# Altium schematic sheet Input.SchDoc
size A4; SheetNumber: 5; SheetTotal: 6
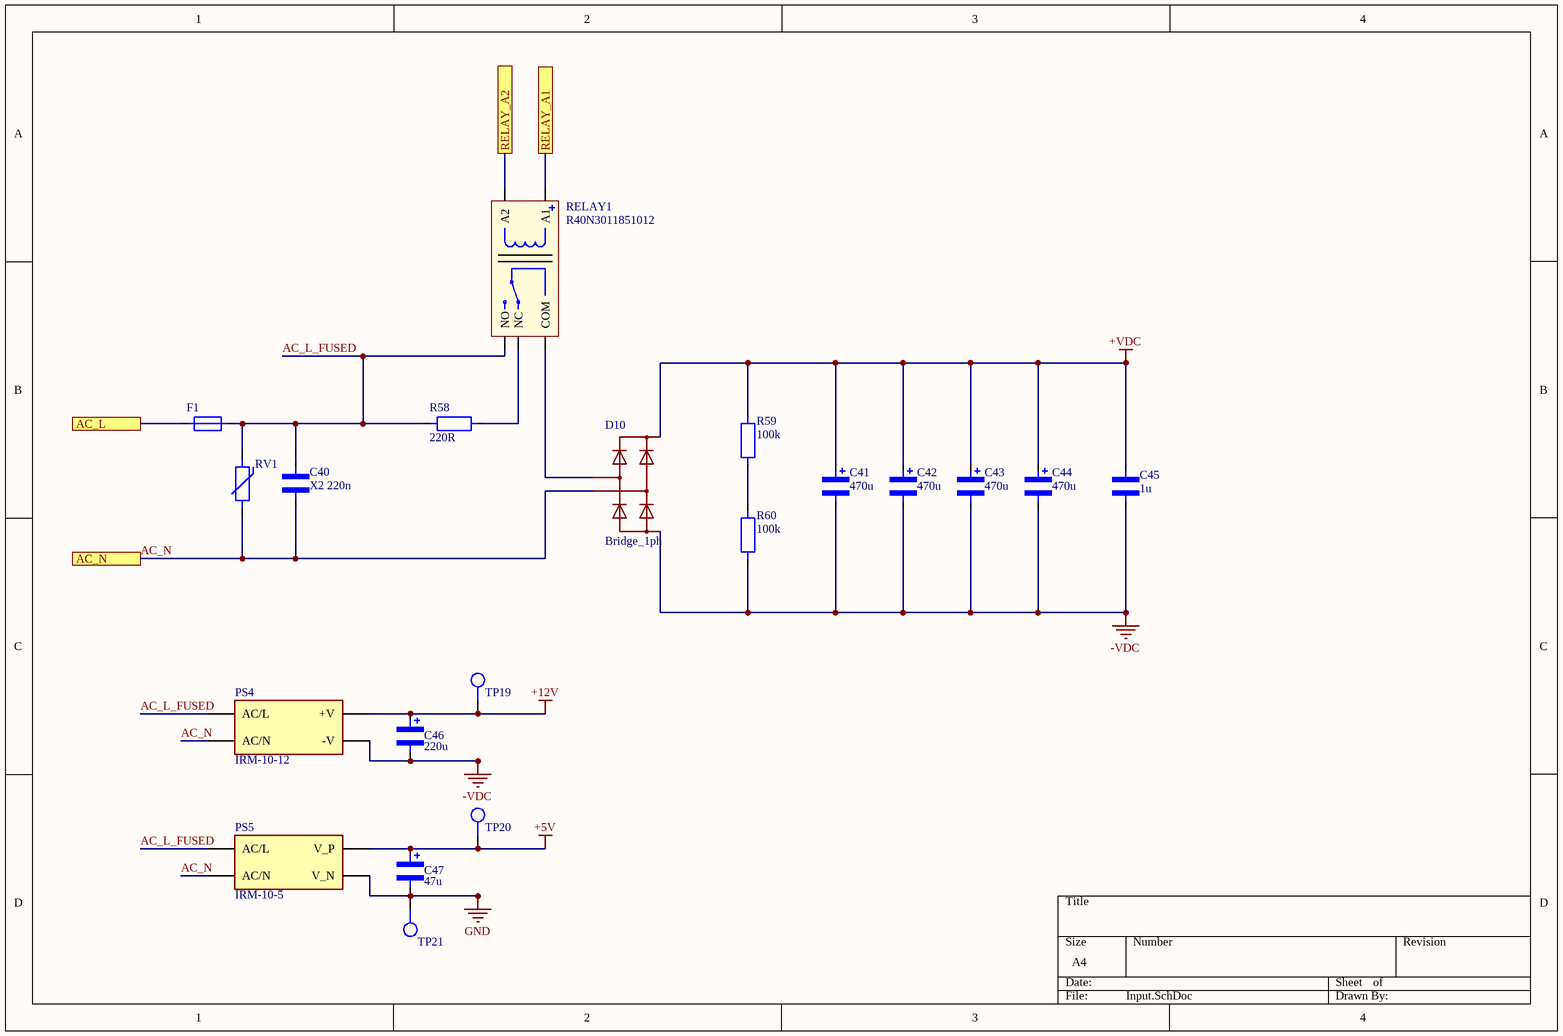
[diagram p0: Input.SchDoc]

## Parts
C40  X2 220n  [R46KN322000M1K]
C41  470u  [HF2G477M35040HC]
C42  470u  [HF2G477M35040HC]
C43  470u  [HF2G477M35040HC]
C44  470u  [HF2G477M35040HC]
C45  1u  [MPP-1UR20/630]
C46  220u  [EEUFR1V221]
C47  47u  [RD1C476M05011BB]
D10  Bridge_1ph  [KBPCxxxxFP]
F1  Fuse clips  [0751.0056]  (value not drawn)
PS4  IRM-10-12  [CONV_IRM-10-12]
PS5  IRM-10-5  [CONV_IRM-10-5]
R58  220R  [CRL30W-220R]
R59  100k  [RESISTOR_2512]
R60  100k  [RESISTOR_2512]
RELAY1  R40N3011851012  [R40N3011851012]
RV1  B72220S0271K101  [B72220S0271K101]  (value not drawn)
TP19  TestPoint  [TestPoint_1.5mm]  (value not drawn)
TP20  TestPoint  [TestPoint_1.5mm]  (value not drawn)
TP21  TestPoint  [TestPoint_1.5mm]  (value not drawn)

## Ports
AC_L, AC_N, RELAY_A1, RELAY_A2

## Nets
+5V: C47.2 PS5.4(V_P) TP20.1
+12V: C46.2 PS4.+V TP19.1
+VDC: C41.2 C42.2 C43.2 C44.2 C45.2 D10.1(+) R59.2
-VDC: C41.1 C42.1 C43.1 C44.1 C45.1 C46.1 D10.3(-) PS4.-V R60.1
GND: C47.1 PS5.3(V_N) TP21.1
AC_L: F1.1 ; port AC_L
AC_L_FUSED: C40.2 F1.2 PS4.AC_L(AC/L) PS5.2(AC/L) R58.1 RELAY1.NO RV1.2
AC_N: C40.1 D10.4(Input_~) PS4.AC_N(AC/N) PS5.1(AC/N) RV1.1 ; port AC_N
RELAY_A1: RELAY1.A1 ; port RELAY_A1
RELAY_A2: RELAY1.A2 ; port RELAY_A2
NetD10_2: D10.2(Input_~) RELAY1.COM
NetR58_2: R58.2 RELAY1.NC
NetR59_1: R59.1 R60.2

## Library data of the parts
C40 = R46KN322000M1K: Capacitor: polypropylene; X2; R46; 220nF; 560VDC; 275VAC; THT; ±10%
C41-C44 = HF2G477M35040HC: Capacitor: electrolytic; SNAP-IN; 470uF; 400VDC; Ø35x40mm; ±20%; Value: 470u
C45 = MPP-1UR20/630: Capacitor: polypropylene; 1uF; 630VDC; 22x23.7x15.7mm; THT; ±10%; Value: 1u
C46 = EEUFR1V221: Capacitor: electrolytic; low ESR; THT; 220uF; 35VDC; Ø8x11.5mm
C47 = RD1C476M05011BB: Capacitor: electrolytic; THT; 47uF; 16VDC; Ø5x11mm; Pitch: 2mm; ±20%
D10 = Bridge_1ph: ki_keywords: Bridge 1 phase; ki_description: Bridge_1_phase; Datasheet: https://diotec.com/de/produktliste/B1.html
F1 = 0751.0056: Fuse clips; cylindrical fuses; THT; 5x20mm,6.3x32mm; 16A; bronze; pin to pad: 1>1+2 2>3+4
PS4 = IRM-10-12: Power Supply,AC-DC,12V,0.85A,100-264V In,Encapsulated,Thru-Hole,IRM Series | MEAN WELL IRM-10-12; SnapEDA_Link: https://www.snapeda.com/parts/IRM-10-12/Mean+Well/view-part/?ref=snap; Package: None; Value: *; MF: MEAN WELL; MP: IRM-10-12; Check_prices: https://www.snapeda.com/parts/IRM-10-12/Mean+Well/view-part/?ref=eda
PS5 = IRM-10-5: Enclosed AC DC Converters 1 Output 5V - - - 2A 85 ~ 305 VAC, 120 ~ 430 VDC Input; MF: MEAN WELL; Value: *; Purchase-URL: https://pricing.snapeda.com/search/part/IRM-10-5/?ref=eda; Package: None; Check_prices: https://www.snapeda.com/parts/IRM-10-5/Mean+Well/view-part/?ref=eda; SnapEDA_Link: https://www.snapeda.com/parts/IRM-10-5/Mean+Well/view-part/?ref=snap; Price: None; Availability: In Stock; MP: IRM-10-5
R58 = CRL30W-220R: 30W 220Ω cement resistor; Manufacturer: SR PASSIVES; Tolerance: 5%; Power: 30W; Value: 220R
R59 R60 = RESISTOR_2512: SMD resistor in 2512 package; Value: *
RELAY1 = R40N3011851012: Relay: electromagnetic; Ucoil: 12VDC; SPDT; 40A; max.300VAC; R40N; Manufacturer: RELPOL
RV1 = B72220S0271K101: Varistor: metal-oxide; THT; 275VAC; 350VDC; 430V; 8000A; Ø22.5mm